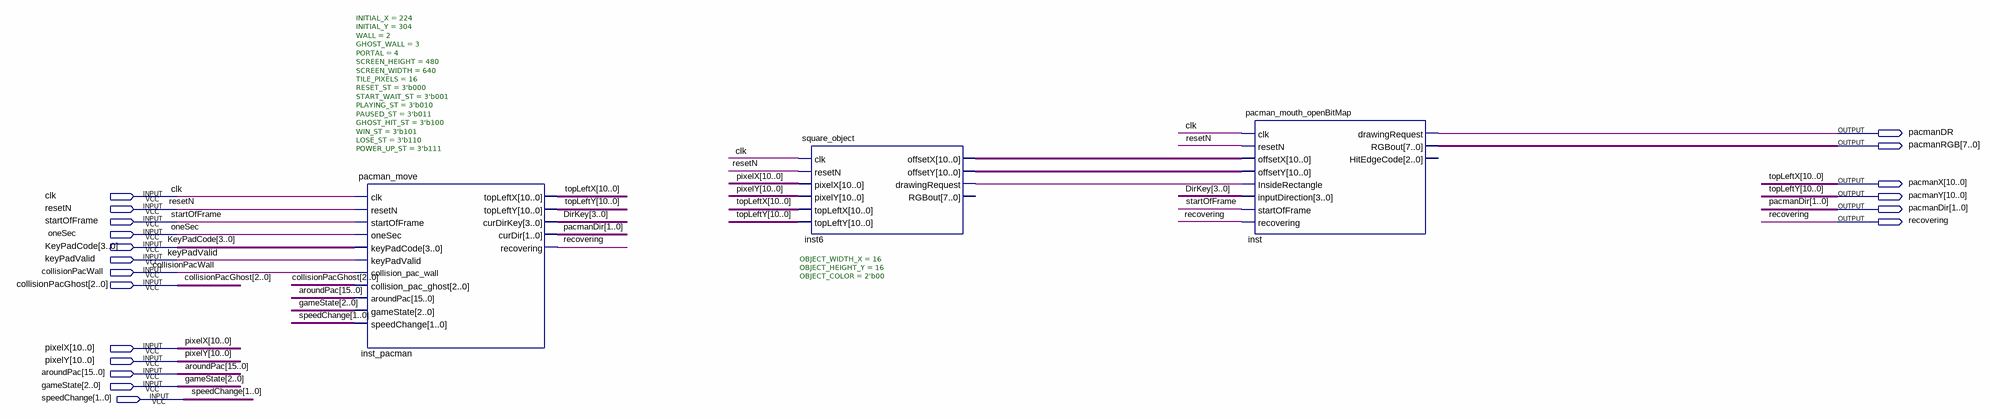
[diagram p0: schematic sheet]
// Quartus schematic Pacman_Player.bdf as structural Verilog: 3 symbols, 19 pins
module Pacman_Player (
  input  clk,
  input  resetN,
  input  startOfFrame,
  input  oneSec,
  input  [3:0] KeyPadCode,
  input  keyPadValid,
  input  collisionPacWall,
  input  [2:0] collisionPacGhost,
  input  [10:0] pixelX,
  input  [10:0] pixelY,
  input  [15:0] aroundPac,
  input  [2:0] gameState,
  input  [1:0] speedChange,
  output pacmanDR,
  output [7:0] pacmanRGB,
  output [10:0] pacmanX,
  output [10:0] pacmanY,
  output [1:0] pacmanDir,
  output recovering
);

  wire inst6_drawingrequest;
  wire [3:0] DirKey;
  wire [10:0] inst6_offsetx, inst6_offsety;

  pacman_move #(.INITIAL_X(224), .INITIAL_Y(304), .WALL(2), .GHOST_WALL(3), .PORTAL(4), .SCREEN_HEIGHT(480), .SCREEN_WIDTH(640), .TILE_PIXELS(16), .RESET_ST(3'b000), .START_WAIT_ST(3'b001), .PLAYING_ST(3'b010), .PAUSED_ST(3'b011), .GHOST_HIT_ST(3'b100), .WIN_ST(3'b101), .LOSE_ST(3'b110), .POWER_UP_ST(3'b111)) inst_pacman (
    .clk(clk), .resetN(resetN), .startOfFrame(startOfFrame), .oneSec(oneSec), .keyPadCode(KeyPadCode),
    .keyPadValid(keyPadValid), .collision_pac_wall(collisionPacWall),
    .collision_pac_ghost(collisionPacGhost), .aroundPac(aroundPac), .gameState(gameState),
    .speedChange(speedChange), .topLeftX(pacmanX), .topLeftY(pacmanY), .curDirKey(DirKey),
    .curDir(pacmanDir), .recovering(recovering));
  square_object #(.OBJECT_WIDTH_X(16), .OBJECT_HEIGHT_Y(16), .OBJECT_COLOR(2'b00)) inst6 (
    .clk(clk), .resetN(resetN), .pixelX(pixelX), .pixelY(pixelY), .topLeftX(pacmanX), .topLeftY(pacmanY),
    .offsetX(inst6_offsetx), .offsetY(inst6_offsety), .drawingRequest(inst6_drawingrequest));  // open: RGBout
  pacman_mouth_openBitMap inst (
    .clk(clk), .resetN(resetN), .offsetX(inst6_offsetx), .offsetY(inst6_offsety),
    .InsideRectangle(inst6_drawingrequest), .inputDirection(DirKey), .startOfFrame(startOfFrame),
    .recovering(recovering), .drawingRequest(pacmanDR), .RGBout(pacmanRGB));  // open: HitEdgeCode

  // Other names for the same wires on the sheet: topLeftX[10:0] = pacmanX; topLeftY[10:0] = pacmanY
endmodule
